# Altium project tracker-pro-airbnb-v1.1.PrjPcb (part 7 of 7)

## Sheet Secondary-PCB.SchDoc
size 420 x 297 mm; SheetNumber: 9; SheetTotal: 10
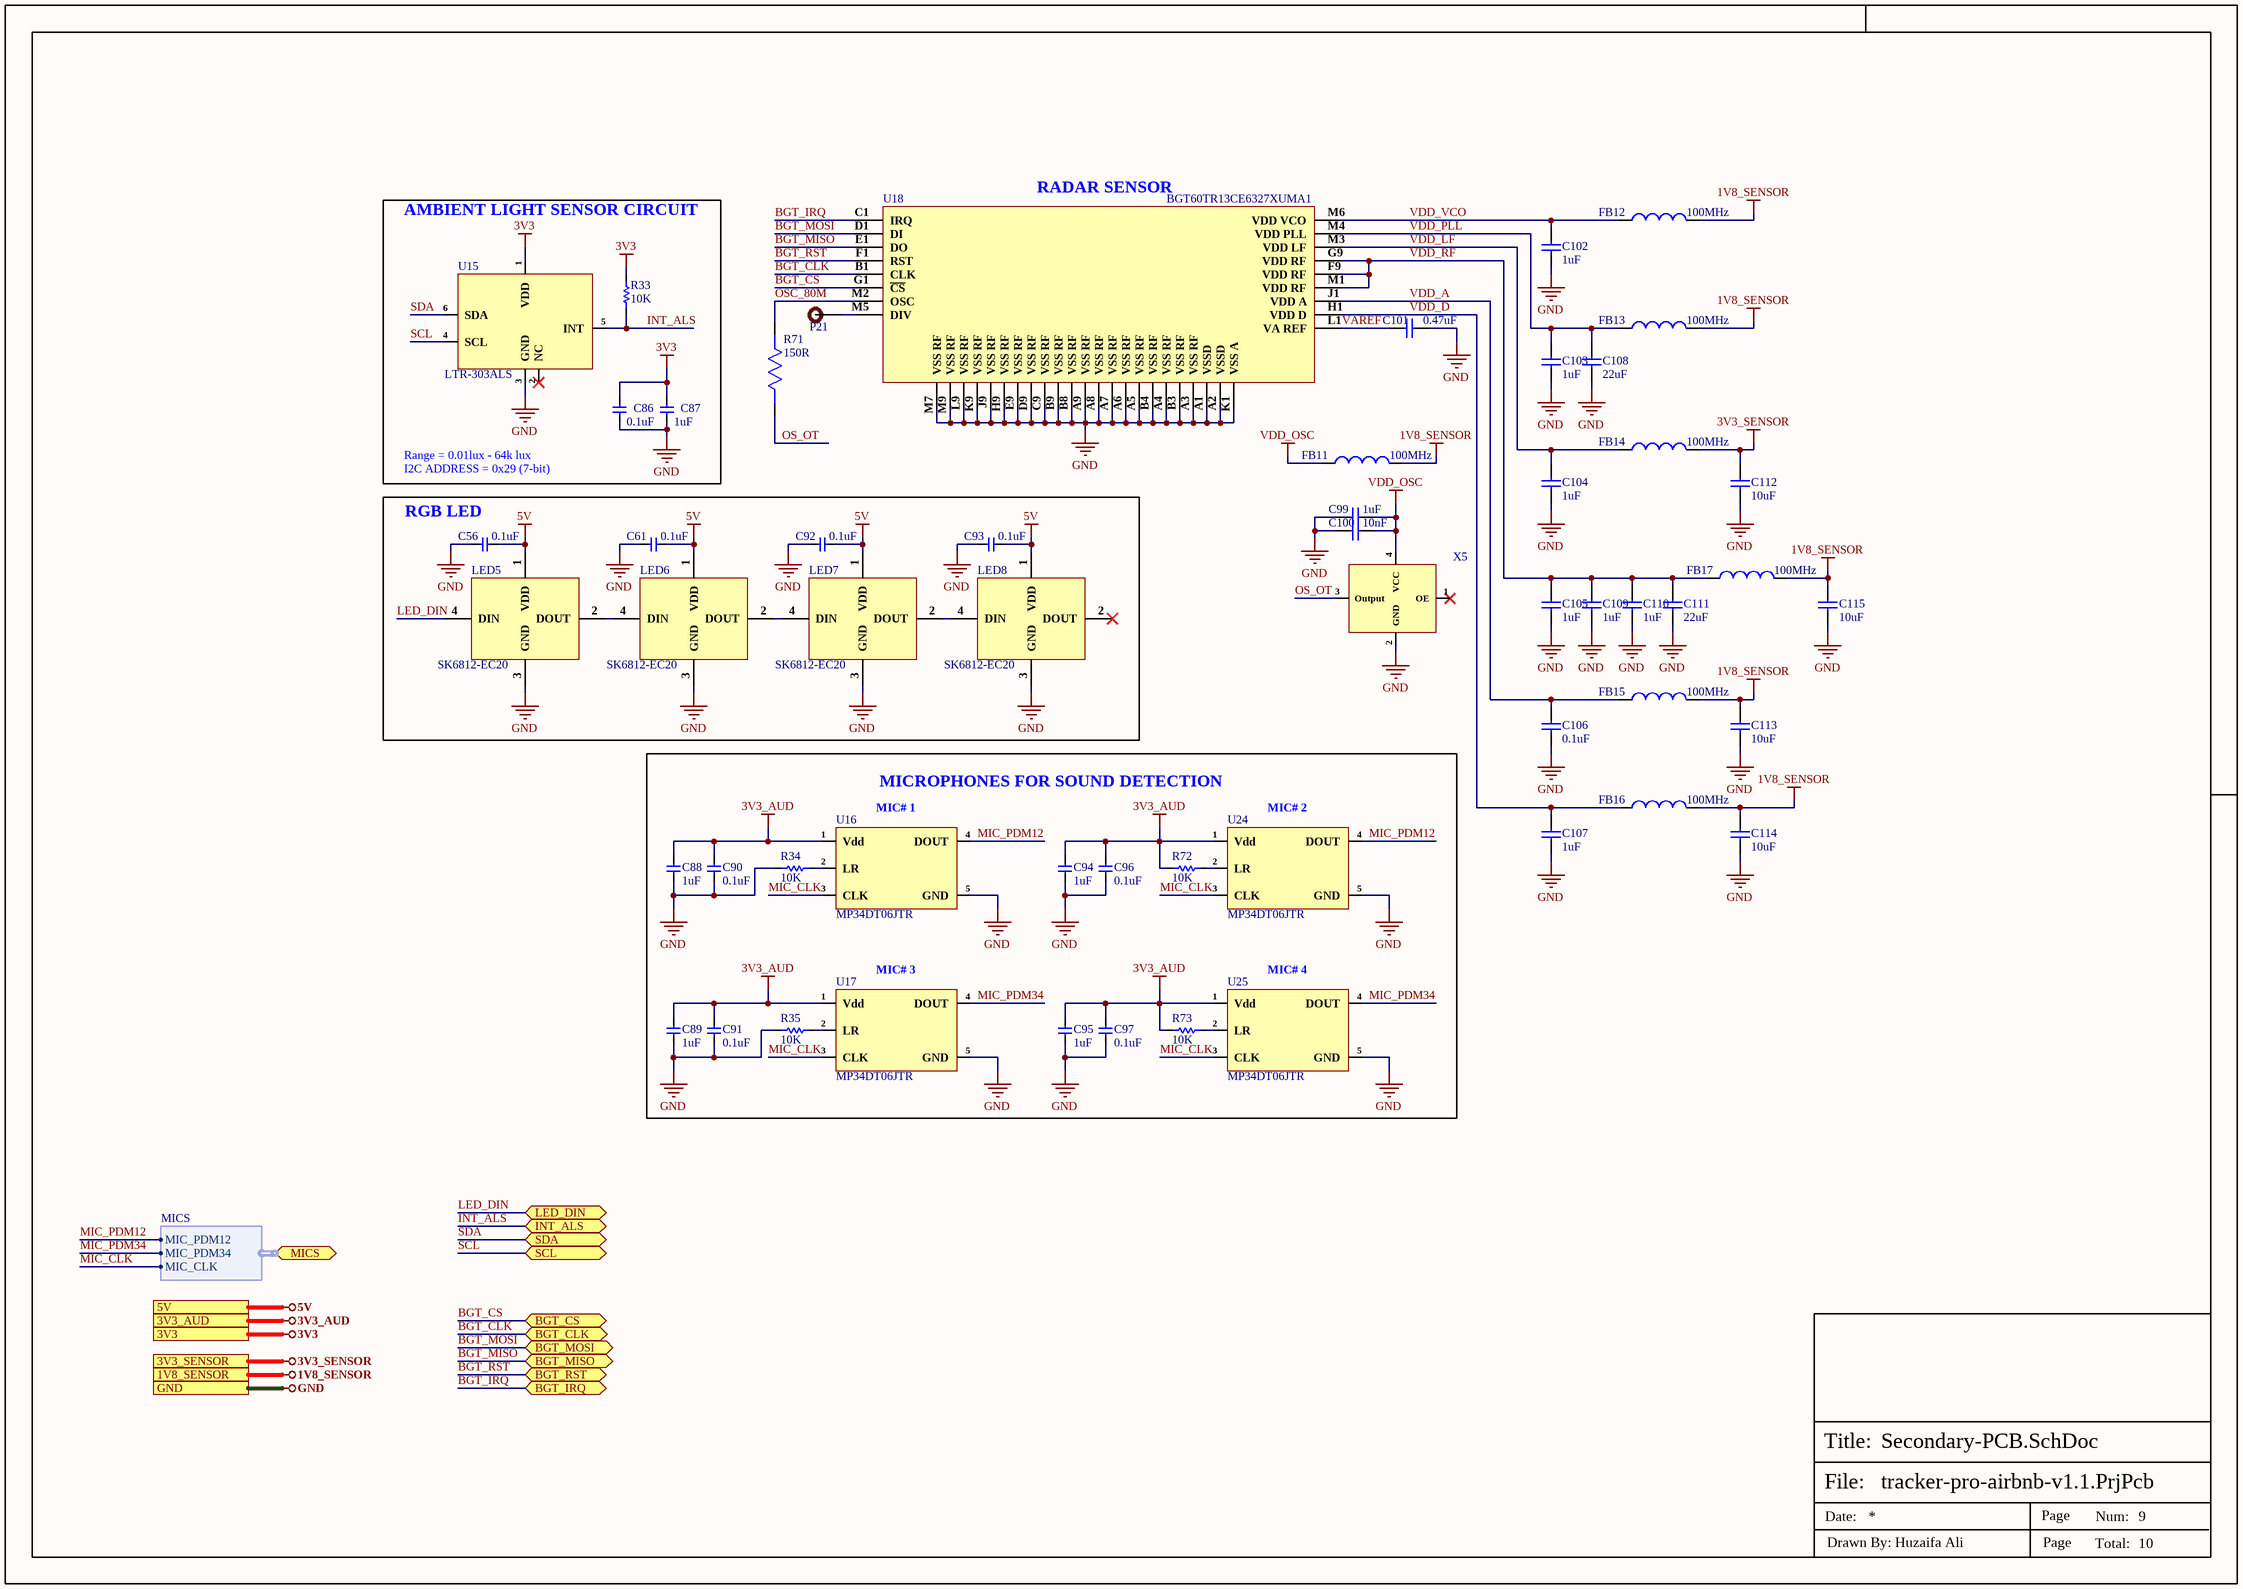
[diagram p8: Secondary-PCB.SchDoc]

### Parts
C56  0.1uF  [Cap-0402]
C61  0.1uF  [Cap-0402]
C86  0.1uF  [Cap-0402]
C87  1uF  [Cap-0402]
C88  1uF  [Cap-0402]
C89  1uF  [Cap-0402]
C90  0.1uF  [Cap-0402]
C91  0.1uF  [Cap-0402]
C92  0.1uF  [Cap-0402]
C93  0.1uF  [Cap-0402]
C94  1uF  [Cap-0402]
C95  1uF  [Cap-0402]
C96  0.1uF  [Cap-0402]
C97  0.1uF  [Cap-0402]
C99  1uF  [Cap-0402]
C100  10nF  [Cap-0402]
C101  0.47uF  [Cap-0402]
C102  1uF  [Cap-0402]
C103  1uF  [Cap-0402]
C104  1uF  [Cap-0402]
C105  1uF  [Cap-0402]
C106  0.1uF  [Cap-0402]
C107  1uF  [Cap-0402]
C108  22uF  [Cap-0603]
C109  1uF  [Cap-0402]
C110  1uF  [Cap-0402]
C111  22uF  [Cap-0603]
C112  10uF  [Cap-0402]
C113  10uF  [Cap-0402]
C114  10uF  [Cap-0402]
C115  10uF  [Cap-0402]
FB11  100MHz  [IND-0402]
FB12  100MHz  [IND-0402]
FB13  100MHz  [IND-0402]
FB14  100MHz  [IND-0402]
FB15  100MHz  [IND-0402]
FB16  100MHz  [IND-0402]
FB17  100MHz  [IND-0402]
LED5  SK6812-EC20  [SK6812-EC20]
LED6  SK6812-EC20  [SK6812-EC20]
LED7  SK6812-EC20  [SK6812-EC20]
LED8  SK6812-EC20  [SK6812-EC20]
P21  TEST POINT  [Test-point]  (value not drawn)
R33  10K  [Res-0603]
R34  10K  [Res-0603]
R35  10K  [Res-0603]
R71  150R  [Res-0402]
R72  10K  [Res-0603]
R73  10K  [Res-0603]
U15  LTR-303ALS  [6-Pin ChipLED]
U16  MP34DT06JTR  [MP34DT06JTR]
U17  MP34DT06JTR  [MP34DT06JTR]
U18  BGT60TR13CE6327XUMA1  [pg-vf2bga-40]
U24  MP34DT06JTR  [MP34DT06JTR]
U25  MP34DT06JTR  [MP34DT06JTR]
X5  YSO690PR  [YSO690PR]  (value not drawn)

### Blocks framed on the sheet
AMBIENT LIGHT SENSOR CIRCUIT: C86 C87 R33 U15
RGB LED: C56 C61 C92 C93 LED5-LED8
MICROPHONES FOR SOUND DETECTION: C88-C91 C94-C97 R34 R35 R72 R73 U16 U17 U24 U25

### Ports
1V8_SENSOR, 3V3, 3V3_AUD, 3V3_SENSOR, 5V, BGT_CLK (bidir), BGT_CS (bidir), BGT_IRQ (bidir), BGT_MISO (bidir), BGT_MOSI (bidir), BGT_RST (bidir), GND, INT_ALS (bidir), LED_DIN (bidir), MICS (bidir, harness MICS), SCL (bidir), SDA (bidir)

### Harnesses
MICS: MIC_PDM12, MIC_CLK, MIC_PDM34

### Nets
1V8_SENSOR: C113.2 C114.2 C115.2 FB11.2 FB12.2 FB13.2 FB15.2 FB16.2 FB17.2 ; port 1V8_SENSOR
3V3: C86.2 C87.2 R33.1 U15.1(VDD) ; port 3V3
3V3_AUD: C88.2 C89.2 C90.2 C91.2 C94.2 C95.2 C96.2 C97.2 R72.2 R73.2 U16.1(Vdd) U17.1(Vdd) U24.1(Vdd) U25.1(Vdd) ; port 3V3_AUD
3V3_SENSOR: C112.2 FB14.2 ; port 3V3_SENSOR
5V: C56.1 C61.1 C92.1 C93.1 LED5.1(VDD) LED6.1(VDD) LED7.1(VDD) LED8.1(VDD) ; port 5V
GND: C56.2 C61.2 C86.1 C87.1 C88.1 C89.1 C90.1 C91.1 C92.2 C93.2 C94.1 C95.1 C96.1 C97.1 C99.2 C100.2 C101.2 C102.1 C103.1 C104.1 C105.1 C106.1 C107.1 C108.1 C109.1 C110.1 C111.1 C112.1 C113.1 C114.1 C115.1 LED5.3(GND) LED6.3(GND) LED7.3(GND) LED8.3(GND) R34.2 R35.2 U15.3(GND) U16.5(GND) U17.5(GND) U18.A1(VSSD) U18.A2(VSSD) U18.A3(VSS_RF) U18.A4(VSS_RF) U18.A5(VSS_RF) U18.A6(VSS_RF) U18.A7(VSS_RF) U18.A8(VSS_RF) U18.A9(VSS_RF) U18.B3(VSS_RF) U18.B4(VSS_RF) U18.B8(VSS_RF) U18.B9(VSS_RF) U18.C9(VSS_RF) U18.D9(VSS_RF) U18.E9(VSS_RF) U18.H9(VSS_RF) U18.J9(VSS_RF) U18.K1(VSS_A) U18.K9(VSS_RF) U18.L9(VSS_RF) U18.M7(VSS_RF) U18.M9(VSS_RF) U24.5(GND) U25.5(GND) X5.2(GND) ; port GND
VDD_OSC: C99.1 C100.1 FB11.1 X5.4(VCC)
BGT_CLK: U18.B1(CLK) ; port BGT_CLK  [project net A2]
BGT_CS: U18.G1(~{CS}) ; port BGT_CS  [project net A1]
BGT_IRQ: U18.C1(IRQ) ; port BGT_IRQ  [project net A6]
BGT_MISO: U18.E1(DO) ; port BGT_MISO  [project net A4]
BGT_MOSI: U18.D1(DI) ; port BGT_MOSI  [project net A3]
BGT_RST: U18.F1(RST) ; port BGT_RST  [project net A5]
INT_ALS: R33.2 U15.5(INT) ; port INT_ALS  [project net GPIO16]
LED_DIN: LED5.4(DIN) ; port LED_DIN
MIC_CLK: U16.3(CLK) U17.3(CLK) U24.3(CLK) U25.3(CLK) ; port MICS.MIC_CLK
MIC_PDM12: U16.4(DOUT) U24.4(DOUT) ; port MICS.MIC_PDM12
MIC_PDM34: U17.4(DOUT) U25.4(DOUT) ; port MICS.MIC_PDM34
OS_OT: R71.2 X5.3(Output)
OSC_80M: R71.1 U18.M2(OSC)
SCL: U15.4(SCL) ; port SCL
SDA: U15.6(SDA) ; port SDA
VAREF: C101.1 U18.L1(VA_REF)
VDD_A: C106.2 FB15.1 U18.J1(VDD_A)
VDD_D: C107.2 FB16.1 U18.H1(VDD_D)
VDD_LF: C104.2 FB14.1 U18.M3(VDD_LF)
VDD_PLL: C103.2 C108.2 FB13.1 U18.M4(VDD_PLL)
VDD_RF: C105.2 C109.2 C110.2 C111.2 FB17.1 U18.F9(VDD_RF) U18.G9(VDD_RF) U18.M1(VDD_RF)
VDD_VCO: C102.2 FB12.1 U18.M6(VDD_VCO)
NetLED5_2: LED5.2(DOUT) LED6.4(DIN)
NetLED6_2: LED6.2(DOUT) LED7.4(DIN)
NetLED7_2: LED7.2(DOUT) LED8.4(DIN)
NetP21_1: P21.1 U18.M5(DIV)
NetR34_1: R34.1 U16.2(LR)
NetR35_1: R35.1 U17.2(LR)
NetR72_1: R72.1 U24.2(LR)
NetR73_1: R73.1 U25.2(LR)

Not connected (* = marked no-connect by the designer): LED8 2(DOUT)*; U15 2(NC)*; X5 1(OE)*

### Notes on the sheet
- (near U18) RADAR SENSOR
- Range = 0.01lux - 64k lux
- I2C ADDRESS = 0x29 (7-bit)
- (near U16) MIC# 1
- (near U24) MIC# 2
- (near U17) MIC# 3
- (near U25) MIC# 4
- File:
- Title:
- Date:
- Page
- Num:
- Total:
- Drawn By: Huzaifa Ali

### Library data of the parts
C56 C61 C86 C92 C93 = C1005X5R1H104K050BB: CAP CER 0.1UF 50V X5R 0402; Manufacturer: TDK; Dielectric Material: Ceramic; Capacitance: 100nF; Tolerance: 10%; Supplier 1: Digi-Key; Manufacturer Part Number: C1005X5R1H104K050BB; Stock 1: 1455182; Pricing 1: 1=0.12, 10=0.09, 50=0.049, 100=0.04, 500=0.02858, 1000=0.02245, 2500=0.02041, 5000=0.01878 (USD); Mount: Surface Mount; Case/Package: 0402; Case Code (Metric): 1005; Case Code (Imperial): 0402; Weight: 2.3E-05oz; Min Operating Temperature: -55°C; Max Operating Temperature: 85°C; Dielectric: X5R; Voltage Rating: 50V; Packaging: Tape and Reel; Voltage Rating (DC): 50V; Termination: SMD/SMT; Construction: Flat; Package Quantity: 1; Resistor Type: Ceramic; Voltage: 50V; Series: C; Length: 1mm; Width: 0.02inch; Height: 0.5mm; Depth: 0.5mm; Thickness: 0.022inch; Radiation Hardening: No; Lead Free: Lead Free; REACH SVHC: No SVHC; RoHS Compliant: Yes; ComponentLink1URL: https://product.tdk.com/info/en/catalog/spec/mlccspec_commercial_general_midvoltage_en.pdf?src-supplier=Digi-Key; ComponentLink1Description: https://product.tdk.com/info/en/catalog/spec/mlccspec_commercial_general_midvoltage_en.pdf?src-supplier=Digi-Key; ComponentLink2URL: http://www.tdk.co.jp/tefe02/e413_c.pdf?src-supplier=Future+Electronics; ComponentLink2Description: http://www.tdk.co.jp/tefe02/e413_c.pdf?src-supplier=Future+Electronics; ComponentLink3URL: https://www.verical.com/server-webapp/html/getDatasheet?partID=743571&src-supplier=Verical; ComponentLink3Description: https://www.verical.com/server-webapp/html/getDatasheet?partID=743571&src-supplier=Verical; ComponentLink4URL: http://www.tdk.co.jp/tefe02/e412_c.pdf?src-supplier=Avnet+Europe; ComponentLink4Description: http://www.tdk.co.jp/tefe02/e412_c.pdf?src-supplier=Avnet+Europe; Supplier Part Number 1: 445-5942-1-ND; LCSC Part Number: C2181865
C87-C89 C94 C95 C99 C102-C105 C107 C109 C110 = CC0402KRX5R6BB105: CAP CER 1UF 10V X5R 0402; Manufacturer: Yageo; Tolerance: 10%; Dissipation Factor: 15%; Supplier 1: Mouser; Manufacturer Part Number: CC0402KRX5R6BB105; RoHS: Yes; Category: Ceramic Capacitors; Stock 1: 6711367; Pricing 1: 1=0.11000, 10=0.05500, 50=0.05500, 100=0.03300, 500=0.02700, 1000=0.02200, 2500=0.02100, 10000=0.01800 (USD); Mount: Surface Mount; Case/Package: 0402; Number of Pins: 2; Case Code (Metric): 1005; Case Code (Imperial): 0402; Min Operating Temperature: -55°C; Max Operating Temperature: 85°C; Capacitance: 1uF; Dielectric: X5R; Package Quantity: 1; Voltage Rating: 10V; Packaging: Tape and Reel; Voltage Rating (DC): 10V; Termination: SMD/SMT; Resistor Type: Ceramic; Series: CC; Construction: Flat; Length: 1mm; Width: 0.02inch; Height: 0.5mm; Thickness: 0.022inch; Depth: 0.5mm; Radiation Hardening: No; REACH SVHC: No SVHC; Lead Free: Lead Free; Halogen Free: Halogen Free; RoHS Compliant: Yes; ComponentLink1URL: https://datasheet.ciiva.com/176/upy-gphc-x5r-4v-to-50v-12-176704.pdf?src-supplier=Digi-Key; ComponentLink1Description: https://datasheet.ciiva.com/176/upy-gphc-x5r-4v-to-50v-12-176704.pdf?src-supplier=Digi-Key; ComponentLink2URL: https://datasheet.ciiva.com/176/mlccorderingcode-176705.pdf?src-supplier=Digi-Key; ComponentLink2Description: https://datasheet.ciiva.com/176/mlccorderingcode-176705.pdf?src-supplier=Digi-Key; ComponentLink3URL: https://datasheet.ciiva.com/176/mlccorderingcode-176706.pdf?src-supplier=Digi-Key; ComponentLink3Description: https://datasheet.ciiva.com/176/mlccorderingcode-176706.pdf?src-supplier=Digi-Key; Supplier Part Number 1: 603-CC402KRX5R6BB105; LCSC Part Number: C106254
C90 C91 C96 C97 = CC0402KRX5R6BB104: CAP CER 0.1UF 10V X5R 0402; Manufacturer: Yageo; Capacitance: 100nF; Tolerance: 10%; Dissipation Factor: 5%; Insulation Resistance: 10GR; Supplier 1: Digi-Key; Manufacturer Part Number: CC0402KRX5R6BB104; RoHS: Yes; Category: Ceramic Capacitors; Stock 1: 6385580; Pricing 1: 1=0.10000, 10=0.02700, 50=0.01500, 100=0.01220, 500=0.00874, 1000=0.00687, 2500=0.00625, 5000=0.00575 (USD); Mount: Surface Mount; Case/Package: 0402; Number of Pins: 2; Case Code (Imperial): 0402; Case Code (Metric): 1005; Min Operating Temperature: -55°C; Max Operating Temperature: 85°C; Dielectric: X5R; Packaging: Tape and Reel; Voltage Rating: 10V; Package Quantity: 1; Termination: SMD/SMT; Voltage Rating (DC): 10V; Series: CC; Length: 1mm; Width: 0.02inch; Height: 0.5mm; Depth: 0.5mm; Thickness: 0.022inch; Radiation Hardening: No; RoHS Compliant: Yes; REACH SVHC: No SVHC; Lead Free: Lead Free; Halogen Free: Halogen Free; ComponentLink1URL: https://datasheet.ciiva.com/144/mlccorderingcode-144029.pdf?src-supplier=Digi-Key; ComponentLink1Description: https://datasheet.ciiva.com/144/mlccorderingcode-144029.pdf?src-supplier=Digi-Key; ComponentLink2URL: https://datasheet.ciiva.com/144/mlccorderingcode-144028.pdf?src-supplier=Digi-Key; ComponentLink2Description: https://datasheet.ciiva.com/144/mlccorderingcode-144028.pdf?src-supplier=Digi-Key; ComponentLink3URL: https://datasheet.ciiva.com/144/mlccorderingcode-144030.pdf?src-supplier=Digi-Key; ComponentLink3Description: https://datasheet.ciiva.com/144/mlccorderingcode-144030.pdf?src-supplier=Digi-Key; ComponentLink4URL: https://datasheet.ciiva.com/7978/1359354-7978091.pdf?src-supplier=Element14; ComponentLink4Description: https://datasheet.ciiva.com/7978/1359354-7978091.pdf?src-supplier=Element14; ComponentLink5URL: https://datasheet.ciiva.com/11587/upy-gphc-x5r-4v-to-50v-12-11587302.pdf?src-supplier=Avnet; ComponentLink5Description: https://datasheet.ciiva.com/11587/upy-gphc-x5r-4v-to-50v-12-11587302.pdf?src-supplier=Avnet; Supplier Part Number 1: 311-1336-1-ND; LCSC Part Number: C129131
C100 = CC0402KRX7R8BB103: CAP CER 10000PF 25V X7R 0402; Manufacturer: Yageo; Tolerance: 10%; Supplier 1: Digi-Key; Manufacturer Part Number: CC0402KRX7R8BB103; Stock 1: 0; Pricing 1: 1=0.1, 10=0.021, 100=0.0093, 500=0.00666, 1000=0.00523, 2500=0.00476, 5000=0.00438 (USD); Mount: Surface Mount; Case/Package: 0402; Case Code (Metric): 1005; Case Code (Imperial): 0402; Min Operating Temperature: -55°C; Max Operating Temperature: 125°C; Capacitance: 10nF; Dielectric: X7R; Voltage Rating: 25V; Package Quantity: 1; Packaging: Tape and Reel; Voltage Rating (DC): 25V; Termination: SMD/SMT; Composition: Ceramic; Length: 1mm; Height: 0.5mm; Depth: 0.5mm; Width: 0.02inch; Thickness: 0.022inch; Radiation Hardening: No; REACH SVHC: Unknown; Lead Free: Lead Free; Halogen Free: Halogen Free; ComponentLink1URL: http://www.yageo.com/documents/recent/UPY-GPHC_X7R_6.3V-to-50V_18.pdf?src-supplier=Digi-Key; ComponentLink1Description: http://www.yageo.com/documents/recent/UPY-GPHC_X7R_6.3V-to-50V_18.pdf?src-supplier=Digi-Key; ComponentLink2URL: https://www.verical.com/server-webapp/html/getDatasheet?partID=375418&src-supplier=Verical; ComponentLink2Description: https://www.verical.com/server-webapp/html/getDatasheet?partID=375418&src-supplier=Verical; ComponentLink3URL: http://www.yageo.com/documents/recent/UPY-GPHC_X7R_6.3V-to-50V_8.pdf?src-supplier=Avnet; ComponentLink3Description: http://www.yageo.com/documents/recent/UPY-GPHC_X7R_6.3V-to-50V_8.pdf?src-supplier=Avnet; ComponentLink4URL: https://4donline.ihs.com/images/VipMasterIC/IC/YAGO/YAGO-S-A0003557223/YAGO-S-A0003557223-1.pdf?hkey=52A5661711E402568146F3353EA87419&src-supplier=Element14; ComponentLink4Description: https://4donline.ihs.com/images/VipMasterIC/IC/YAGO/YAGO-S-A0003557223/YAGO-S-A0003557223-1.pdf?hkey=52A5661711E402568146F3353EA87419&src-supplier=Element14; ComponentLink5URL: http://www.farnell.com/datasheets/2167236.pdf?src-supplier=Element14; ComponentLink5Description: http://www.farnell.com/datasheets/2167236.pdf?src-supplier=Element14; ComponentLink6URL: http://www.mouser.com/ds/2/447/Yageo_UPY-GP_NP0_16V-to-50V_9-358835.pdf?src-supplier=Mouser; ComponentLink6Description: http://www.mouser.com/ds/2/447/Yageo_UPY-GP_NP0_16V-to-50V_9-358835.pdf?src-supplier=Mouser; Supplier Part Number 1: 311-1337-1-ND; LCSC Part Number: C327025
C101 = UMK105ABJ474KV-F: CAP CER 0.47UF 50V X5R 0402; Manufacturer: Taiyo Yuden; Capacitance: 470nF; Tolerance: 10%; Item Type: Capacitor; Supplier 1: Digi-Key; Manufacturer Part Number: UMK105ABJ474KV-F; RoHS: Yes; Category: Ceramic Capacitors; Stock 1: 145003; Pricing 1: 1=0.24000, 10=0.16100, 50=0.09680, 100=0.08170, 500=0.05592, 1000=0.04946, 2500=0.04731, 5000=0.04301 (USD); Mount: Surface Mount; Case/Package: 0402; Case Code (Metric): 1005; Case Code (Imperial): 0402; Min Operating Temperature: -55°C; Max Operating Temperature: 85°C; Package Quantity: 10000; Packaging: Tape and Reel; Voltage Rating: 50V; Voltage Rating (DC): 50V; Dielectric: X5R; Termination: SMD/SMT; Length: 0.039inch; Width: 0.02inch; Height: 0.5mm; Thickness: 0.022inch; Lead Free: Lead Free; RoHS Compliant: Yes; ComponentLink1URL: https://datasheet.ciiva.com/30249/584umk105abj474kv-f-30249824.pdf?src-supplier=Onlinecomponents.com; ComponentLink1Description: https://datasheet.ciiva.com/30249/584umk105abj474kv-f-30249824.pdf?src-supplier=Onlinecomponents.com; ComponentLink2URL: https://datasheet.ciiva.com/24370/10umk105abj474kv-f-24370678.pdf?src-supplier=Onlinecomponents.com; ComponentLink2Description: https://datasheet.ciiva.com/24370/10umk105abj474kv-f-24370678.pdf?src-supplier=Onlinecomponents.com; ComponentLink3URL: https://datasheet.ciiva.com/18697/mlcc-all-e-18697429.pdf?src-supplier=Digi-Key; ComponentLink3Description: https://datasheet.ciiva.com/18697/mlcc-all-e-18697429.pdf?src-supplier=Digi-Key; ComponentLink4URL: https://datasheet.ciiva.com/18697/mlcc-all-e-18697430.pdf?src-supplier=Digi-Key; ComponentLink4Description: https://datasheet.ciiva.com/18697/mlcc-all-e-18697430.pdf?src-supplier=Digi-Key; ComponentLink5URL: https://datasheet.ciiva.com/18697/mlcc-all-e-18697431.pdf?src-supplier=Digi-Key; ComponentLink5Description: https://datasheet.ciiva.com/18697/mlcc-all-e-18697431.pdf?src-supplier=Digi-Key; Supplier Part Number 1: 587-3497-1-ND; LCSC Part Number: C386109
C106 = CL05B104KB54PNC: CAP CER 0.1UF 50V X7R 0402; Manufacturer: Samsung; Supplier 1: Digi-Key; Manufacturer Part Number: CL05B104KB54PNC; Stock 1: 8594; Pricing 1: 1=0.1, 10=0.067, 50=0.0366, 100=0.0299, 500=0.02138, 1000=0.01681, 2500=0.01528, 5000=0.01406 (USD); Supplier Part Number 1: 1276-CL05B104KB54PNCDKR-ND; LCSC Part Number: C307331
C108 C111 = CC0603MRX5R6BB226: CAP CER 22UF 10V X5R 0603; Manufacturer: Yageo; Tolerance: 20%; Supplier 1: Digi-Key; Manufacturer Part Number: CC0603MRX5R6BB226; RoHS: Yes; Category: Ceramic Capacitors; Stock 1: 19628; Pricing 1: 1=0.68000, 10=0.48000, 50=0.36300, 100=0.31610, 500=0.23416, 1000=0.19903 (USD); Mount: Surface Mount; Case/Package: 0603; Case Code (Metric): 1608; Case Code (Imperial): 0603; Weight: 7.1E-05oz; Min Operating Temperature: -55°C; Max Operating Temperature: 85°C; Packaging: Tape and Reel; Capacitance: 22uF; Voltage Rating: 10V; Dielectric: X5R; Termination: SMD/SMT; Voltage Rating (DC): 10V; Package Quantity: 4000; Length: 0.063inch; Width: 0.8mm; Height: 0.8mm; Thickness: 0.035inch; Lead Free: Lead Free; Halogen Free: Halogen Free; RoHS Compliant: Yes; ComponentLink1URL: http://www.mouser.com/ds/2/447/Yageo_UPY-GP_NP0_16V-to-50V_9-358835.pdf?src-supplier=Mouser; ComponentLink1Description: http://www.mouser.com/ds/2/447/Yageo_UPY-GP_NP0_16V-to-50V_9-358835.pdf?src-supplier=Mouser; ComponentLink2URL: http://www.yageo.com/documents/recent/UPY-GPHC_X5R_4V-to-50V_25.pdf?src-supplier=Digi-Key; ComponentLink2Description: http://www.yageo.com/documents/recent/UPY-GPHC_X5R_4V-to-50V_25.pdf?src-supplier=Digi-Key; Supplier Part Number 1: 311-1819-1-ND; LCSC Part Number: C109447
C112-C115 = CL05A106MP5NUNC: CAP CER 10UF 10V X5R 0402; Manufacturer: Samsung; Tolerance: 20%; Item Type: Capacitor; Supplier 1: Avnet; Manufacturer Part Number: CL05A106MP5NUNC; RoHS: Yes; Category: Ceramic Capacitors; Stock 1: 1729850; Pricing 1: 10000=0.02537 (USD); Mount: Surface Mount; Case/Package: 0402; Case Code (Metric): 1005; Case Code (Imperial): 0402; Contact Plating: Tin; Min Operating Temperature: -55°C; Max Operating Temperature: 85°C; Package Quantity: 1; Packaging: Tape and Reel; Capacitance: 10uF; Voltage Rating: 10V; Dielectric: X5R; Termination: Wraparound; Series: CL; Construction: Flat; Length: 1mm; Width: 0.02inch; Thickness: 0.028inch; Depth: 0.5mm; Radiation Hardening: No; Lead Free: Lead Free; RoHS Compliant: Yes; ComponentLink1URL: https://datasheet.ciiva.com/25721/cl05a106mp5nunc-25721584.pdf?src-supplier=Digi-Key; ComponentLink1Description: https://datasheet.ciiva.com/25721/cl05a106mp5nunc-25721584.pdf?src-supplier=Digi-Key; ComponentLink2URL: https://datasheet.ciiva.com/26838/getdatasheetpartid-745310-26838170.pdf?src-supplier=Verical; ComponentLink2Description: https://datasheet.ciiva.com/26838/getdatasheetpartid-745310-26838170.pdf?src-supplier=Verical; Supplier Part Number 1: CL05A106MP5NUNC; LCSC Part Number: C315248
FB11-FB17 = BLM15PD121SN1D: FERRITE BEAD 120 OHM 0402 1LN; Manufacturer: Murata; Material: Steel,Ferrite; Tolerance: 25%; Impedance: 120R; Current Rating: 1.3A; Number of Lines: 1; DC Resistance (DCR): 90mR; Supplier 1: Avnet; Manufacturer Part Number: BLM15PD121SN1D; RoHS: Yes; Category: Ferrite Beads and Chips; Stock 1: 300000; Pricing 1: 10000=0.03238, 20000=0.03063, 40000=0.02888, 60000=0.02713, 80000=0.02538, 100000=0.02363, 1000000=0.02188 (USD); Case/Package: 0402; Number of Pins: 2; Core Material: Ferrite; Case Code (Metric): 1005; Case Code (Imperial): 0402; Min Operating Temperature: -55°C; Max Operating Temperature: 125°C; Package Quantity: 1; Packaging: Tape and Reel; Max Current Rating: 1.3A; Termination: SMD/SMT; Max DC Current: 1.3A; Test Frequency: 100MHz; DC Current: 1.3A; Number of Circuits: 1; Series: BLM15PD; DC Resistance-Max: 90mR; Length: 1mm; Width: 0.5mm; Height: 0.5mm; Depth: 0.55mm; Radiation Hardening: No; Reach SVHC Compliant: Yes; Military Standard: Not; Lead Free: Lead Free; RoHS Compliant: Yes; ComponentLink1URL: https://datasheet.ciiva.com/11800/0900766b811b5866-11800860.pdf?src-supplier=RSComponents; ComponentLink1Description: https://datasheet.ciiva.com/11800/0900766b811b5866-11800860.pdf?src-supplier=RSComponents; ComponentLink2URL: https://datasheet.ciiva.com/18093/getdatasheetpartid-195858-18093157.pdf?src-supplier=Verical; ComponentLink2Description: https://datasheet.ciiva.com/18093/getdatasheetpartid-195858-18093157.pdf?src-supplier=Verical; ComponentLink3URL: https://datasheet.ciiva.com/41425/001171686-da-01-en-chip-drossel0402-120r-1300ma-1-0x0-5mm-41425776.pdf?src-supplier=Conrad; ComponentLink3Description: https://datasheet.ciiva.com/41425/001171686-da-01-en-chip-drossel0402-120r-1300ma-1-0x0-5mm-41425776.pdf?src-supplier=Conrad; ComponentLink4URL: https://datasheet.ciiva.com/41449/001172205-da-01-en-drossel-0402-120r-11-0x0-5mm-10000st-41449495.pdf?src-supplier=Conrad; ComponentLink4Description: https://datasheet.ciiva.com/41449/001172205-da-01-en-drossel-0402-120r-11-0x0-5mm-10000st-41449495.pdf?src-supplier=Conrad; ComponentLink5URL: https://datasheet.ciiva.com/1012/l0110e-1012435.pdf?src-supplier=Digi-Key; ComponentLink5Description: https://datasheet.ciiva.com/1012/l0110e-1012435.pdf?src-supplier=Digi-Key; ComponentLink6URL: https://datasheet.ciiva.com/1012/l0110e-1012434.pdf?src-supplier=Digi-Key; ComponentLink6Description: https://datasheet.ciiva.com/1012/l0110e-1012434.pdf?src-supplier=Digi-Key; ComponentLink7URL: https://datasheet.ciiva.com/1012/l0110e-1012436.pdf?src-supplier=Digi-Key; ComponentLink7Description: https://datasheet.ciiva.com/1012/l0110e-1012436.pdf?src-supplier=Digi-Key; Supplier Part Number 1: BLM15PD121SN1D; LCSC Part Number: C76891; Item Type: Ferrite Bead
LED5-LED8 = SK6812-EC20: 5mA -40℃~+80℃ RGB SMD,2x2mm Light Emitting Diodes (LED) ROHS; Manufacturer: OPSCO Optoelectronics; Item Type: RGB LED; Manufacturer Part Number: SK6812-EC20; Package: SMD,2x2mm; LCSC Part Number: C2909058; ComponentLink1Description: LCSC; ComponentLink1URL: https://www.lcsc.com/product-detail/Light-Emitting-Diodes-LED_OPSCO-Optoelectronics-SK6812-EC20_C2909058.html
P21 = TEST POINT: Test Point ON; Item Type: TEST POINT
R33-R35 R72 R73 = RC0603FR-0710KL: RES SMD 10K Ohm 1% 1/10W 0603; Manufacturer: Yageo; Resistance: 10kR; Temperature Coefficient: 100ppm/°C; Voltage Rating (DC): 50V; Power Rating: 100mW; Voltage Rating: 75V; Item Type: Resistor; Supplier 1: Digi-Key; Manufacturer Part Number: RC0603FR-0710KL; RoHS: Yes; Category: Chip SMD Resistors; Stock 1: 25249139; Pricing 1: 1=0.10000, 10=0.02400, 100=0.00970, 1000=0.00436, 2500=0.00378 (USD); Case/Package: 0603; Number of Pins: 2; Case Code (Imperial): 0603; Case Code (Metric): 1608; Weight: 7.1E-05oz; Size Code: 0603; Min Operating Temperature: -55°C; Max Operating Temperature: 155°C; Tolerance: 1%; Resistor Type: Thick Film; Packaging: Tape and Reel; Termination: SMD/SMT; Features: Moisture Resistant; Series: RC; Max Power Dissipation: 100mW; Number of Terminations: 2; Resistance Tolerance: 1%; Construction: Rectangular; Length: 1.6mm; Width: 0.8mm; Height: 0.45mm; Depth: 0.8mm; Lead Pitch: 0.3mm; REACH SVHC: Unknown; Lead Free: Lead Free; Military Standard: Not; RoHS Compliant: Yes; ComponentLink1URL: https://datasheet.ciiva.com/7660/38590-7660789.pdf?src-supplier=Element14; ComponentLink1Description: https://datasheet.ciiva.com/7660/38590-7660789.pdf?src-supplier=Element14; ComponentLink2URL: https://datasheet.ciiva.com/7983/443971-7983596.pdf?src-supplier=Element14; ComponentLink2Description: https://datasheet.ciiva.com/7983/443971-7983596.pdf?src-supplier=Element14; ComponentLink3URL: https://datasheet.ciiva.com/22747/443971-22747519.pdf?src-supplier=Element14; ComponentLink3Description: https://datasheet.ciiva.com/22747/443971-22747519.pdf?src-supplier=Element14; ComponentLink4URL: https://datasheet.ciiva.com/46440/1868787-46440891.pdf?src-supplier=Element14; ComponentLink4Description: https://datasheet.ciiva.com/46440/1868787-46440891.pdf?src-supplier=Element14; ComponentLink5URL: https://datasheet.ciiva.com/7746/1738695-7746239.pdf?src-supplier=Element14; ComponentLink5Description: https://datasheet.ciiva.com/7746/1738695-7746239.pdf?src-supplier=Element14; ComponentLink6URL: https://datasheet.ciiva.com/15189/getdatasheetpartid-409289-15189591.pdf?src-supplier=Verical; ComponentLink6Description: https://datasheet.ciiva.com/15189/getdatasheetpartid-409289-15189591.pdf?src-supplier=Verical; Supplier Part Number 1: 311-10.0KHRCT-ND; LCSC Part Number: C98220
R71 = ERJ-2GEJ151X: RES SMD 150 OHM 5% 1/10W 0402; Manufacturer: Panasonic; Power Rating: 100mW; Voltage Rating: 50V; Temperature Coefficient: 200ppm/°C; Item Type: Resistor; Supplier 1: Avnet; Manufacturer Part Number: ERJ-2GEJ151X; RoHS: Yes; Category: Chip SMD Resistors; Stock 1: 19191; Pricing 1: 1=0.10100, 25=0.03200, 100=0.01300, 250=0.01100, 500=0.00900, 1000=0.00500 (USD); Mount: Surface Mount; Case/Package: 0402; Case Code (Imperial): 0402; Case Code (Metric): 1005; Weight: 2.8E-05oz; Contact Plating: Tin; Min Operating Temperature: -55°C; Max Operating Temperature: 155°C; Resistance: 150R; Tolerance: 5%; Packaging: Tape and Reel; Package Quantity: 10000; Resistor Type: Thick Film; Termination: SMD/SMT; Number of Terminations: 2; Max Power Dissipation: 100mW; Voltage Rating (DC): 50V; Working Voltage: 50V; Features: Automotive AEC-Q200; Series: ERJ; Technology: THICK FILM; Construction: Rectangular; Resistance Tolerance: 5%; Length: 1mm; Width: 0.5mm; Height: 0.35mm; Depth: 0.5mm; Ratings: AEC-Q200; Radiation Hardening: No; Reach SVHC Compliant: Yes; Military Standard: Not; Lead Free: Lead Free; RoHS Compliant: Yes; ComponentLink1URL: https://datasheet.ciiva.com/11821/0900766b80f806dd-11821182.pdf?src-supplier=RSComponents; ComponentLink1Description: https://datasheet.ciiva.com/11821/0900766b80f806dd-11821182.pdf?src-supplier=RSComponents; ComponentLink2URL: https://datasheet.ciiva.com/43460/1500035-43460367.pdf?src-supplier=Farnell; ComponentLink2Description: https://datasheet.ciiva.com/43460/1500035-43460367.pdf?src-supplier=Farnell; ComponentLink3URL: https://datasheet.ciiva.com/6082/1500035-6082105.pdf?src-supplier=Farnell; ComponentLink3Description: https://datasheet.ciiva.com/6082/1500035-6082105.pdf?src-supplier=Farnell; ComponentLink4URL: https://datasheet.ciiva.com/46377/1500035-46377070.pdf?src-supplier=Element14; ComponentLink4Description: https://datasheet.ciiva.com/46377/1500035-46377070.pdf?src-supplier=Element14; ComponentLink5URL: https://datasheet.ciiva.com/28568/1678796-28568939.pdf?src-supplier=Element14; ComponentLink5Description: https://datasheet.ciiva.com/28568/1678796-28568939.pdf?src-supplier=Element14; ComponentLink6URL: https://datasheet.ciiva.com/16773/70260739-16773454.pdf?src-supplier=Allied+Electronics; ComponentLink6Description: https://datasheet.ciiva.com/16773/70260739-16773454.pdf?src-supplier=Allied+Electronics; ComponentLink7URL: https://datasheet.ciiva.com/30178/4aoa0000ce1-30178453.pdf?src-supplier=Onlinecomponents.com; ComponentLink7Description: https://datasheet.ciiva.com/30178/4aoa0000ce1-30178453.pdf?src-supplier=Onlinecomponents.com; Supplier Part Number 1: 65T8254; LCSC Part Number: C412976
U15 = LTR-303ALS-01: SENSOR OPT AMBIENT 6DFN; Manufacturer: Vishay Lite-On; Output Type: I2C; Item Type: Ambient Light Sensor; Supplier 1: Arrow Electronics; Manufacturer Part Number: LTR-303ALS-01; RoHS: Yes; Category: Uncategorized; Stock 1: 1717; Pricing 1: 1=0.5742, 10=0.465, 25=0.4604, 100=0.394, 250=0.39, 500=0.3741, 1000=0.3355 (USD); Mounting Technology: Surface Mount; Case/Package: DFN; Pins: 6; Min Operating Temperature: -30°C; Max Operating Temperature: 70°C; Packaging: Cut Tape; Series: -; RoHS Compliant: Yes; ComponentLink1URL: http://optoelectronics.liteon.com/upload/download/DS86-2013-0004/LTR-303ALS-01_DS_V1.pdf?src-supplier=Digi-Key; ComponentLink1Description: http://optoelectronics.liteon.com/upload/download/DS86-2013-0004/LTR-303ALS-01_DS_V1.pdf?src-supplier=Digi-Key; ComponentLink2URL: http://optoelectronics.liteon.com/upload/download/DS86-2013-0004/P_100_LTR-303ALS-01%20DS.pdf?src-supplier=Avnet; ComponentLink2Description: http://optoelectronics.liteon.com/upload/download/DS86-2013-0004/P_100_LTR-303ALS-01%20DS.pdf?src-supplier=Avnet; Supplier Part Number 1: LTR-303ALS-01; LCSC Part Number: C364577
U16 U17 U24 U25 = MP34DT06JTR: MIC MEMS DIGITAL PDM OMNI -26DB; Manufacturer: STMicroelectronics; Shape: Rectangular; Direction: Omnidirectional; Voltage Rating: 1.8V; Operating Supply Current: 650uA; Item Type: Microphone; Supplier 1: Mouser; Manufacturer Part Number: MP34DT06JTR; RoHS: Yes; Category: Microphones; Stock 1: 6064; Pricing 1: 1=2.31, 10=1.92, 50=1.6, 100=1.51, 1000=1.24, 10000=1.23 (USD); Packaging: Cut Tape; Termination: Solder; Series: -; RoHS Compliant: Yes; ComponentLink1URL: http://www.farnell.com/datasheets/2710895.pdf?src-supplier=Farnell; ComponentLink1Description: http://www.farnell.com/datasheets/2710895.pdf?src-supplier=Farnell; ComponentLink2URL: https://www.st.com/resource/en/datasheet/mp34dt06j.pdf?src-supplier=Digi-Key; ComponentLink2Description: https://www.st.com/resource/en/datasheet/mp34dt06j.pdf?src-supplier=Digi-Key; ComponentLink3URL: http://www.farnell.com/datasheets/2710895.pdf?src-supplier=Newark; ComponentLink3Description: http://www.farnell.com/datasheets/2710895.pdf?src-supplier=Newark; ComponentLink4URL: http://www.farnell.com/datasheets/2710895.pdf?src-supplier=Element14; ComponentLink4Description: http://www.farnell.com/datasheets/2710895.pdf?src-supplier=Element14; Supplier Part Number 1: 511-MP34DT06JTR; LCSC Part Number: C503097
U18 = BGT60TR13CE6327XUMA1: Rf Transceiver PG-VF2BGA-40; Manufacturer: Infineon; Item Type: IC; Supplier 1: Newark; Manufacturer Part Number: BGT60TR13CE6327XUMA1; RoHS: No; Category: RF Receivers, Transceivers; Stock 1: 4397; Pricing 1: 1=20.67000, 10=18.89000, 25=17.50000, 50=16.72000, 100=15.93000, 250=15.16000, 500=14.94000, 1000=14.51000 (USD); Supplier Part Number 1: 25AK0242; LCSC Part Number: C3606641; ComponentLink1Description: LCSC; ComponentLink1URL: https://www.lcsc.com/product-detail/RF-Transceiver-ICs_Infineon-Technologies-BGT60TR13CE6327XUMA1_C3606641.html
X5 = YSO690PR: 80.00000MHz 3.3V-/+20PPM; Manufacturer: YXC; Manufacturer Part number: YSO690PR; ComponentLink1Description: Datasheet; ComponentLink1URL: http://oss.mokotechnology.com/uploads/20240304/1709535755274_YSO690PR%2080MHZ%203.3V%20%C2%B120PPM%20CMOS%20O97EI-112-80M.pdf

## Sheet TestPoint-Sheet.SchDoc
size A4; SheetNumber: 10; SheetTotal: 10
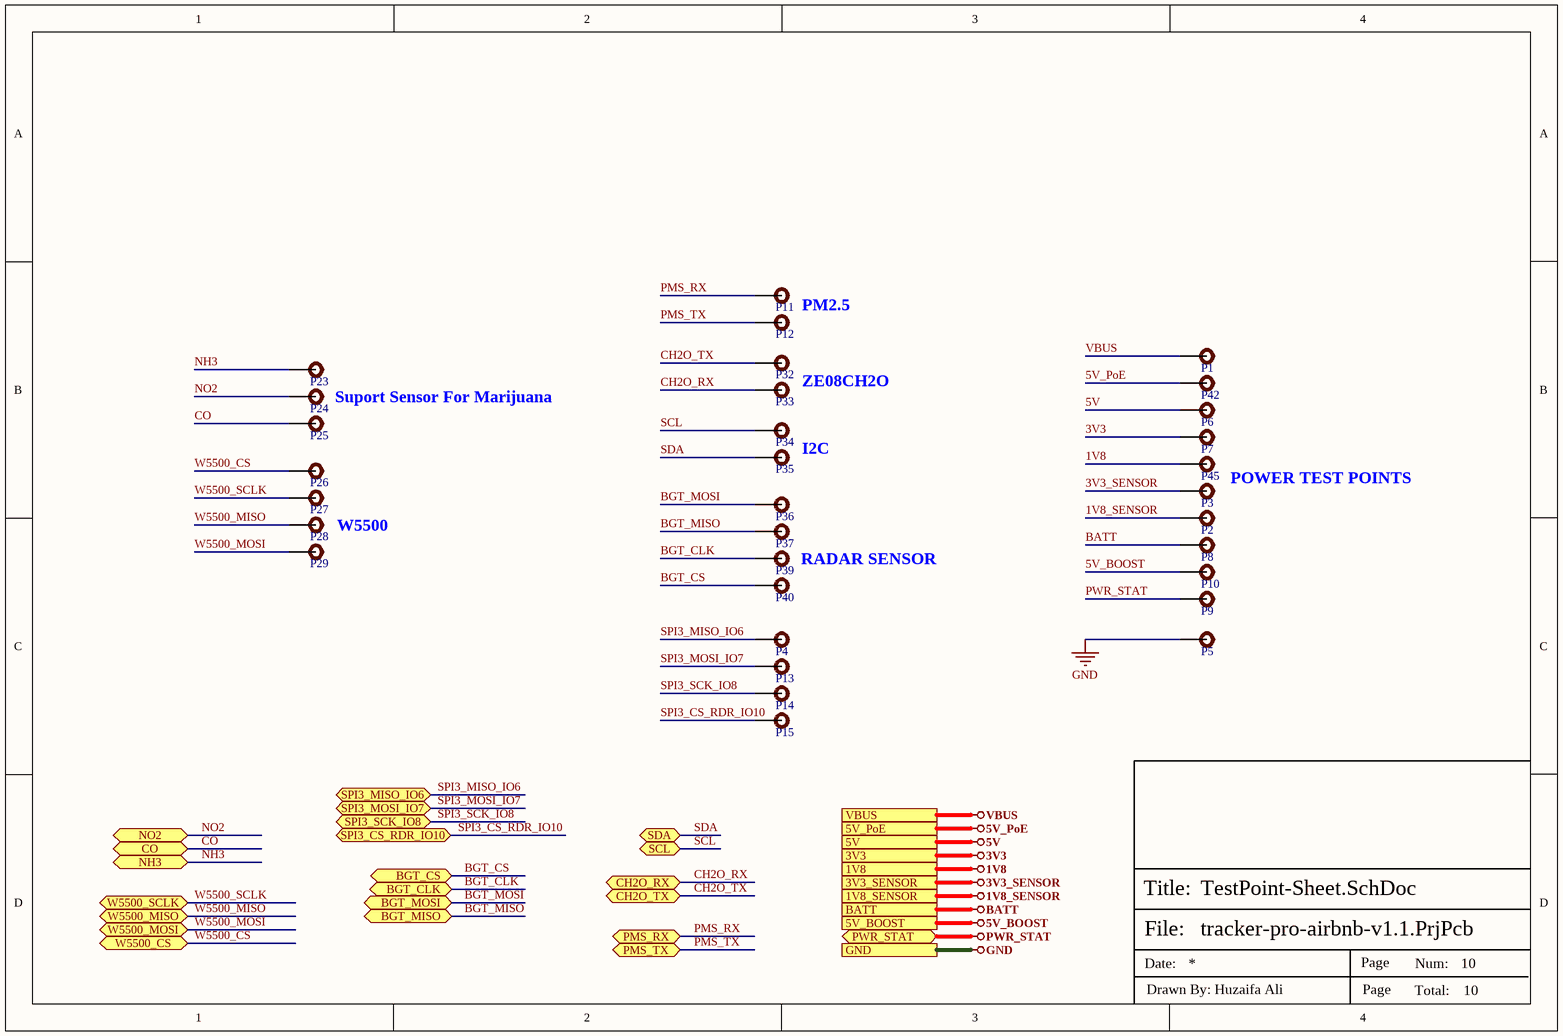
[diagram p9: TestPoint-Sheet.SchDoc]

### Parts
P1  TEST POINT  [Test-point]  (value not drawn)  (no BOM)
P2  TEST POINT  [Test-point]  (value not drawn)  (no BOM)
P3  TEST POINT  [Test-point]  (value not drawn)  (no BOM)
P4  TEST POINT  [Test-point]  (value not drawn)
P5  TEST POINT  [Test-point]  (value not drawn)
P6  TEST POINT  [Test-point]  (value not drawn)  (no BOM)
P7  TEST POINT  [Test-point]  (value not drawn)  (no BOM)
P8  TEST POINT  [Test-point]  (value not drawn)
P9  TEST POINT  [Test-point]  (value not drawn)
P10  TEST POINT  [Test-point]  (value not drawn)
P11  TEST POINT  [Test-point]  (value not drawn)
P12  TEST POINT  [Test-point]  (value not drawn)
P13  TEST POINT  [Test-point]  (value not drawn)
P14  TEST POINT  [Test-point]  (value not drawn)
P15  TEST POINT  [Test-point]  (value not drawn)
P23  TEST POINT  [Test-point]  (value not drawn)  (no BOM)
P24  TEST POINT  [Test-point]  (value not drawn)  (no BOM)
P25  TEST POINT  [Test-point]  (value not drawn)  (no BOM)
P26  TEST POINT  [Test-point]  (value not drawn)  (no BOM)
P27  TEST POINT  [Test-point]  (value not drawn)  (no BOM)
P28  TEST POINT  [Test-point]  (value not drawn)  (no BOM)
P29  TEST POINT  [Test-point]  (value not drawn)  (no BOM)
P32  TEST POINT  [Test-point]  (value not drawn)  (no BOM)
P33  TEST POINT  [Test-point]  (value not drawn)  (no BOM)
P34  TEST POINT  [Test-point]  (value not drawn)  (no BOM)
P35  TEST POINT  [Test-point]  (value not drawn)  (no BOM)
P36  TEST POINT  [Test-point]  (value not drawn)  (no BOM)
P37  TEST POINT  [Test-point]  (value not drawn)  (no BOM)
P39  TEST POINT  [Test-point]  (value not drawn)  (no BOM)
P40  TEST POINT  [Test-point]  (value not drawn)  (no BOM)
P42  TEST POINT  [Test-point]  (value not drawn)  (no BOM)
P45  TEST POINT  [Test-point]  (value not drawn)  (no BOM)

### Ports
1V8, 1V8_SENSOR, 3V3, 3V3_SENSOR, 5V, 5V_BOOST, 5V_PoE, BATT, BGT_CLK (bidir), BGT_CS (bidir), BGT_MISO (bidir), BGT_MOSI (bidir), CH2O_RX (bidir), CH2O_TX (bidir), CO (bidir), GND, NH3 (bidir), NO2 (bidir), PMS_RX (bidir), PMS_TX (bidir), PWR_STAT (bidir), SCL (bidir), SDA (bidir), SPI3_CS_RDR_IO10 (bidir), SPI3_MISO_IO6 (bidir), SPI3_MOSI_IO7 (bidir), SPI3_SCK_IO8 (bidir), VBUS, W5500_CS (bidir), W5500_MISO (bidir), W5500_MOSI (bidir), W5500_SCLK (bidir)

### Nets
1V8: P45.1 ; port 1V8
1V8_SENSOR: P2.1 ; port 1V8_SENSOR
3V3: P7.1 ; port 3V3
3V3_SENSOR: P3.1 ; port 3V3_SENSOR
5V: P6.1 ; port 5V
5V_BOOST: P10.1 ; port 5V_BOOST
5V_PoE: P42.1 ; port 5V_PoE
BATT: P8.1 ; port BATT
GND: P5.1 ; port GND
PWR_STAT: P9.1 ; port PWR_STAT
VBUS: P1.1 ; port VBUS
BGT_CLK: P39.1 ; port BGT_CLK  [project net A2]
BGT_CS: P40.1 ; port BGT_CS  [project net A1]
BGT_MISO: P37.1 ; port BGT_MISO  [project net A4]
BGT_MOSI: P36.1 ; port BGT_MOSI  [project net A3]
CH2O_RX: P33.1 ; port CH2O_RX
CH2O_TX: P32.1 ; port CH2O_TX
CO: P25.1 ; port CO
NH3: P23.1 ; port NH3
NO2: P24.1 ; port NO2
PMS_RX: P11.1 ; port PMS_RX  [project net GPIO40]
PMS_TX: P12.1 ; port PMS_TX  [project net GPIO41]
SCL: P34.1 ; port SCL
SDA: P35.1 ; port SDA
SPI3_CS_RDR_IO10: P15.1 ; port SPI3_CS_RDR_IO10  [project net B1]
SPI3_MISO_IO6: P4.1 ; port SPI3_MISO_IO6  [project net B4]
SPI3_MOSI_IO7: P13.1 ; port SPI3_MOSI_IO7  [project net B3]
SPI3_SCK_IO8: P14.1 ; port SPI3_SCK_IO8  [project net B2]
W5500_CS: P26.1 ; port W5500_CS  [project net SPI2_CS_IO5]
W5500_MISO: P28.1 ; port W5500_MISO  [project net SPI2_MISO_IO1]
W5500_MOSI: P29.1 ; port W5500_MOSI  [project net SPI2_MOSI_IO2]
W5500_SCLK: P27.1 ; port W5500_SCLK  [project net SPI2_SCK_IO4]

### Notes on the sheet
- PM2.5
- ZE08CH2O
- Suport Sensor For Marijuana
- W5500
- I2C
- POWER TEST POINTS
- RADAR SENSOR
- File:
- Title:
- Date:
- Page
- Num:
- Total:
- Drawn By: Huzaifa Ali

### Library data of the parts
P1-P15 P23-P29 P32-P37 P39 P40 P42 P45 = TEST POINT: Test Point ON; Item Type: TEST POINT

## Nets that join several sheets
1V8: Power-Sheet (C12.2 C14.2 FB4.1 U2.5), Sensor-Sheet (C117.2 U26.4), TestPoint-Sheet (P45.1)
1V8_SENSOR: Power-Sheet (C16.2 FB4.2), Level_Shifter_Sheet (FB7.1), Secondary-PCB (9 pins), TestPoint-Sheet (P2.1)
3V3: Power-Sheet (C19.1 U3.2), Charging-Boost-Sheet (R13.2), Sensor-Sheet (17 pins), Level_Shifter_Sheet (FB8.1), ESP32-Sheet (30 pins), Ethernet-PoE-Sheet (C69.2 Q6.2 R55.1 R56.2), Secondary-PCB (C86.2 C87.2 R33.1 U15.1), TestPoint-Sheet (P7.1)
3V3_AUD: Sound-Detection-Sheet (16 pins), Secondary-PCB (14 pins)
3V3_SENSOR: Power-Sheet (C15.2 FB3.2), Secondary-PCB (C112.2 FB14.2), TestPoint-Sheet (P3.1)
5V: Power-Sheet (7 pins), Charging-Boost-Sheet (U5.2 U5.7), Sensor-Sheet (6 pins), ESP32-Sheet (LS1.2 R42.1), Sound-Detection-Sheet (C36.2 U12.4 U12.6), Secondary-PCB (8 pins), TestPoint-Sheet (P6.1)
5V_BOOST: Charging-Boost-Sheet (5 pins), TestPoint-Sheet (P10.1)
5V_PoE: Power-Sheet (Q1.3), Charging-Boost-Sheet (Q2.3), Ethernet-PoE-Sheet (D8.1), TestPoint-Sheet (P42.1)
BATT: Charging-Boost-Sheet (5 pins), TestPoint-Sheet (P8.1)
GND: Power-Sheet (29 pins), Charging-Boost-Sheet (16 pins), Sensor-Sheet (21 pins), Level_Shifter_Sheet (C34.1 C35.1 U11.11), ESP32-Sheet (31 pins), Ethernet-PoE-Sheet (43 pins), Sound-Detection-Sheet (28 pins), Secondary-PCB (66 pins), TestPoint-Sheet (P5.1)
PWR_STAT: Charging-Boost-Sheet (R13.1 U5.8), Sound-Detection-Sheet (U13.61), TestPoint-Sheet (P9.1)
VBUS: Power-Sheet (5 pins), Charging-Boost-Sheet (5 pins), TestPoint-Sheet (P1.1)
W5500_RST: ESP32-Sheet (U10.16), Ethernet-PoE-Sheet (R69.2 U23.37)
A1: Level_Shifter_Sheet (U11.1), Secondary-PCB (U18.G1), TestPoint-Sheet (P40.1)
A2: Level_Shifter_Sheet (U11.3), Secondary-PCB (U18.B1), TestPoint-Sheet (P39.1)
A3: Level_Shifter_Sheet (U11.4), Secondary-PCB (U18.D1), TestPoint-Sheet (P36.1)
A4: Level_Shifter_Sheet (U11.5), Secondary-PCB (U18.E1), TestPoint-Sheet (P37.1)
A5: Level_Shifter_Sheet (U11.6), Secondary-PCB (U18.F1)
A6: Level_Shifter_Sheet (U11.7), Secondary-PCB (U18.C1)
B1: Level_Shifter_Sheet (U11.20), ESP32-Sheet (U10.15), TestPoint-Sheet (P15.1)
B2: Level_Shifter_Sheet (U11.18), ESP32-Sheet (U10.13), TestPoint-Sheet (P14.1)
B3: Level_Shifter_Sheet (U11.17), ESP32-Sheet (U10.12), TestPoint-Sheet (P13.1)
B4: Level_Shifter_Sheet (U11.16), ESP32-Sheet (U10.11), TestPoint-Sheet (P4.1)
B5: Level_Shifter_Sheet (U11.15), ESP32-Sheet (U10.19)
B6: Level_Shifter_Sheet (U11.14), ESP32-Sheet (U10.21)
CH2O_RX: Sensor-Sheet (SB6.1), ESP32-Sheet (U10.36), TestPoint-Sheet (P33.1)
CH2O_TX: Sensor-Sheet (SB5.1), ESP32-Sheet (U10.51), TestPoint-Sheet (P32.1)
CO: Sensor-Sheet (R22.2 U8.H), ESP32-Sheet (U19.6), TestPoint-Sheet (P25.1)
GPIO9: ESP32-Sheet (U10.14), Sound-Detection-Sheet (U13.16)
GPIO12: ESP32-Sheet (U10.17), Ethernet-PoE-Sheet (R68.2 U23.36)
GPIO13: ESP32-Sheet (U10.18), Ethernet-PoE-Sheet (Q7.1)
GPIO16: ESP32-Sheet (U10.22), Secondary-PCB (R33.2 U15.5)
GPIO38: ESP32-Sheet (U10.43), Sound-Detection-Sheet (U13.17)
GPIO39: Sensor-Sheet (J5.3 Q4.1 R24.1), ESP32-Sheet (U10.44)
GPIO40: Sensor-Sheet (J5.4), ESP32-Sheet (U10.45), TestPoint-Sheet (P11.1)
GPIO41: Sensor-Sheet (J5.5), ESP32-Sheet (U10.47), TestPoint-Sheet (P12.1)
GPIO42: Sensor-Sheet (J5.6 R23.1), ESP32-Sheet (U10.48)
LED_DIN: ESP32-Sheet (R43.2), Secondary-PCB (LED5.4)
MIC_CLK: Sound-Detection-Sheet (C38.2 R29.2), Secondary-PCB (U16.3 U17.3 U24.3 U25.3)
MIC_PDM12: Sound-Detection-Sheet (U13.36), Secondary-PCB (U16.4 U24.4)
MIC_PDM34: Sound-Detection-Sheet (U13.23), Secondary-PCB (U17.4 U25.4)
NH3: Sensor-Sheet (R21.2 U8.D), ESP32-Sheet (U19.5), TestPoint-Sheet (P23.1)
NO2: Sensor-Sheet (R20.2 U8.A), ESP32-Sheet (U19.4), TestPoint-Sheet (P24.1)
SCL: Sensor-Sheet (U7.3 U9.4 U26.2), ESP32-Sheet (R37.1 U10.23 U19.10 U27.6), Secondary-PCB (U15.4), TestPoint-Sheet (P34.1)
SDA: Sensor-Sheet (U7.4 U9.3 U26.1), ESP32-Sheet (R38.1 U10.24 U19.9 U27.7), Secondary-PCB (U15.6), TestPoint-Sheet (P35.1)
SPI2_CS_IO5: ESP32-Sheet (U10.10), Ethernet-PoE-Sheet (U23.32), TestPoint-Sheet (P26.1)
SPI2_MISO_IO1: ESP32-Sheet (U10.6), Ethernet-PoE-Sheet (U23.34), TestPoint-Sheet (P28.1)
SPI2_MOSI_IO2: ESP32-Sheet (U10.7), Ethernet-PoE-Sheet (U23.35), TestPoint-Sheet (P29.1)
SPI2_SCK_IO4: ESP32-Sheet (U10.9), Ethernet-PoE-Sheet (U23.33), TestPoint-Sheet (P27.1)
Tamper_Sw: Sensor-Sheet (R32.1 SW4.1), ESP32-Sheet (U27.1)
USB_N: Power-Sheet (D1.4 J1.A7 J1.B7), ESP32-Sheet (U10.25)
USB_P: Power-Sheet (D1.3 J1.A6 J1.B6), ESP32-Sheet (U10.26)